# EasyEDA Pro project emg_analog_frontend.epro

# Schematic Schematic1
Assembly Variant: Basic; Board Name: Board1; Create Date: 2026-09-30; Page Name: P1; Project Name: esp32_demo; Schematic Name: Schematic1; Update Date: 2026-09-30; Company: 嘉立创EDA; Page Size: A4; Version: V1.0
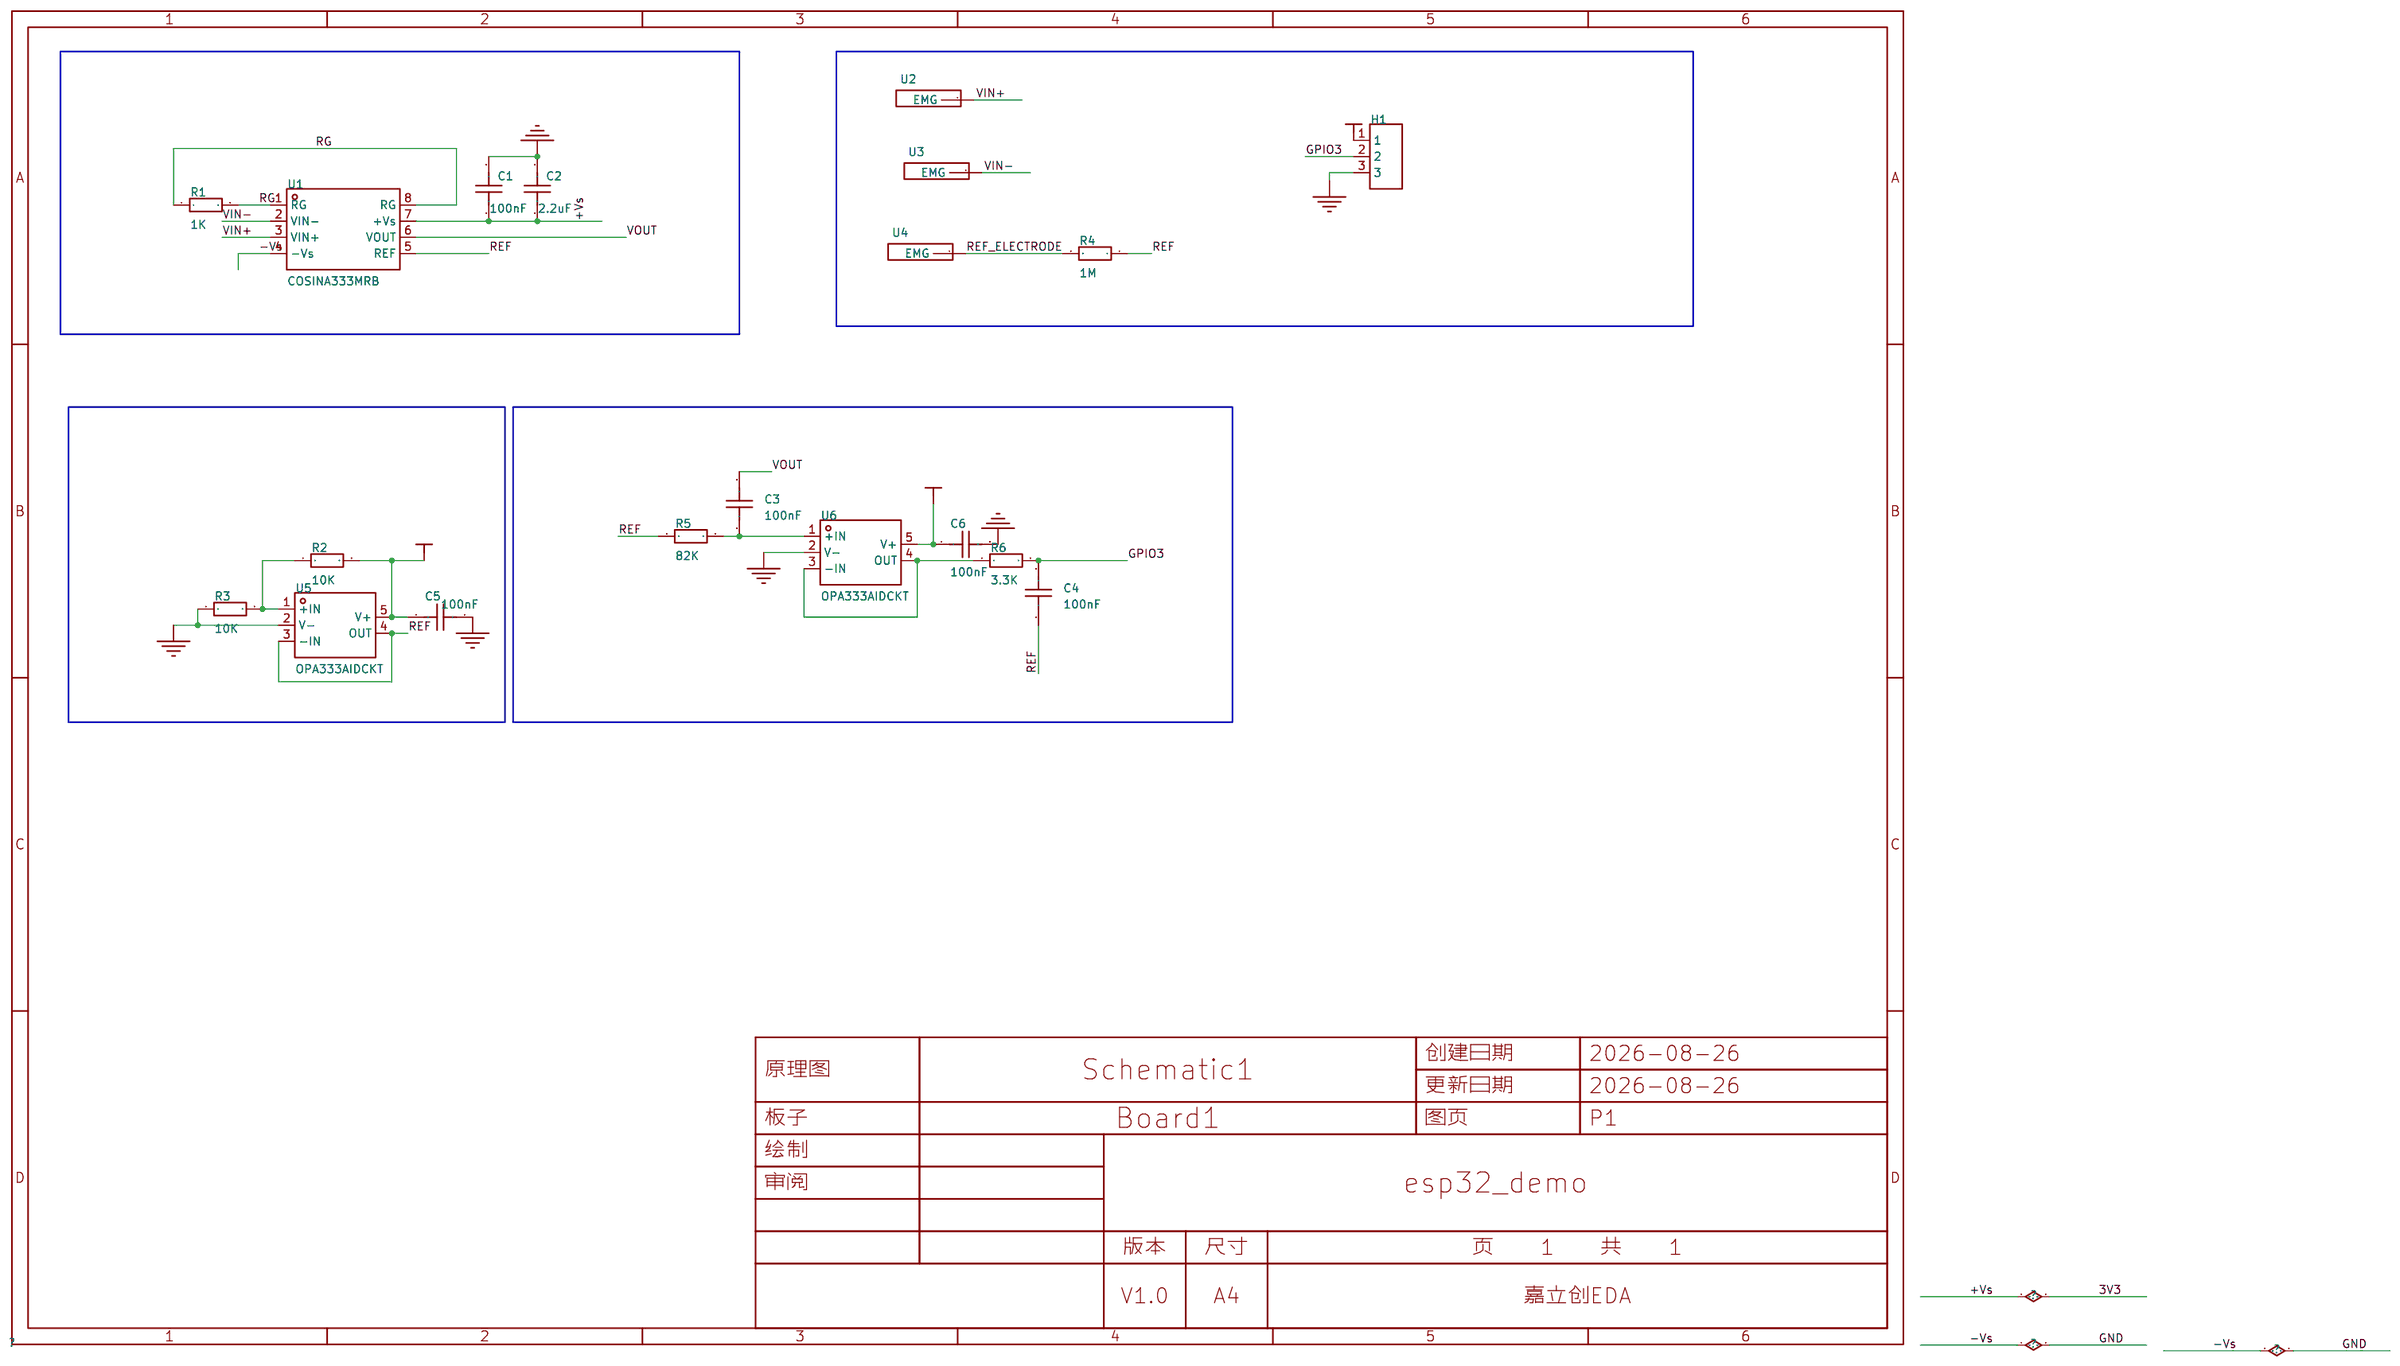
[diagram p0: schematic sheet]

## Parts
C1  100nF  [C0603]
C2  2.2uF  [C0603]
C3  100nF  [C0603]
C4  100nF  [C0603]
C5  100nF  [C0603]
C6  100nF  [C0603]
H1  -  [HDR-TH_3P-P2.54-V-F]
R1  1K  [R0603]
R2  10K  [R0603]
R3  10K  [R0603]
R4  1M  [R0603]
R5  82K  [R0603]
R6  3.3K  [R0603]
U1  COSINA333MRB  [MSOP-8_L3.0-W3.0-P0.65-LS4.9-BL]
U2  -  [sEMG_Electrode_12x6_R1.2]
U3  -  [sEMG_Electrode_12x6_R1.2]
U4  -  [sEMG_Electrode_12x6_R1.2]
U5  OPA333AIDCKT  [SC-70-5_L2.0-W1.3-P0.65-LS2.1-BL]
U6  OPA333AIDCKT  [SC-70-5_L2.0-W1.3-P0.65-LS2.1-BL]

## Library data of the parts
C1-C6 = CAP_0603: Supplier Footprint: 0603
H1 = HDR-F_2.54_1x3P: Supplier Part: C541850; Supplier Footprint: 插件
R1-R6 = Res_0603: Supplier Footprint: 0603
U1 = COSINA333MRB: 放大器数:单路;共模抑制比(CMRR):120dB;输入偏置电流(Ib):200pA;输入失调电压(Vos):25uV;压摆率(SR):0.25V/us;轨到轨:轨到轨输入,轨到轨输出;; LCSC Part Name: 1.8V - 5.5V, 70uA, RRIO零漂移仪表放大器; Supplier Part: C17702539; Manufacturer: COSINE(科山芯创); Supplier Footprint: MSOP-8; JLCPCB Part Class: Extended Part; Datasheet: https://item.szlcsc.com/datasheet/COSINA333MRB/18841710.html; Supplier: LCSC; Number of Channels: 单路; Common Mode Rejection Ratio(CMRR): 120dB; Ib - Input Bias Current: 200pA; Vos - Input Offset Voltage: 25uV; Slew Rate: 0.25V/us; Output Current: 50mA; Rail to Rail: 轨到轨输入,轨到轨输出; Quiescent Current(Iq): 70uA; Input Offset Voltage Drift(Vos TC): 50nV/℃; Operating Temperature: -40℃~+125℃; Input Voltage Noise Density: 50nV/√Hz@1kHz; Input Offset Current(Ios): 3pA; Single Supply: 1.8V~5.5V; Dual Supply: -2.75V~-900mV；900mV~2.75V; Power Supply Rejection Ratio (PSRR): 130dB; Features: 外部电阻增益；零漂移/自动稳零
U2-U4 = sEMG_Electrode_Oval_12x6: 腰圆形体表肌电干电极，12×6mm，底层焊盘
U5 U6 = OPA333AIDCKT: 放大器数:单路;增益带宽积(GBP):350kHz;输入偏置电流(Ib):70pA;输入失调电压(Vos):10uV;压摆率(SR):0.16V/us;轨到轨:轨到轨输入,轨到轨输出;; LCSC Part Name: OPAx333 1.8V微功耗CMOS运算放大器零漂移系列; Supplier Part: C2057324; Manufacturer: TI(德州仪器); Supplier Footprint: SC-70-5; JLCPCB Part Class: Extended Part; Datasheet: https://www.ti.com/cn/lit/gpn/opa333; Supplier: LCSC; Number of Channels: 单路; Gain Bandwidth Product: 350kHz; Ib - Input Bias Current: 70pA; Vos - Input Offset Voltage: 10uV; Common Mode Rejection Ratio(CMRR): 130dB; Slew Rate: 0.16V/us; Output Current: 5mA; Rail to Rail: 轨到轨输入,轨到轨输出; Input Offset Voltage Drift(Vos TC): 50nV/℃; Quiescent Current(Iq): 17uA; Operating Temperature: -40℃~+125℃; Single Supply: 1.8V~5.5V; Maximum Power Supply Range (Vdd-Vss): 5.5V; Input Offset Current(Ios): 400pA

## Nets
3V3: C1.1 C2.1 C5.1 C6.1 H1.1 R2.2 U1.7(+Vs) U5.5(V+) U6.5(V+)
GND: C1.2 C2.2 C5.2 C6.2 H1.3 R3.1 U1.4(-Vs) U5.2(V-) U6.2(V-)
VIN+: U1.3(VIN+) U2.1(EMG)
VIN-: U1.2(VIN-) U3.1(EMG)
GPIO3: C4.2 H1.2 R6.2
REF: C4.1 R4.1 R5.1 U1.5(REF) U5.3(-IN) U5.4(OUT)
REF_ELECTRODE: R4.2 U4.1(EMG)
RG: R1.1 R1.2 U1.1(RG) U1.8(RG)
VOUT: C3.2 U1.6(VOUT)
$1N87: R2.1 R3.2 U5.1(+IN)
$1N101: C3.1 R5.2 U6.1(+IN)
$1N103: R6.1 U6.3(-IN) U6.4(OUT)

# Board PCB1
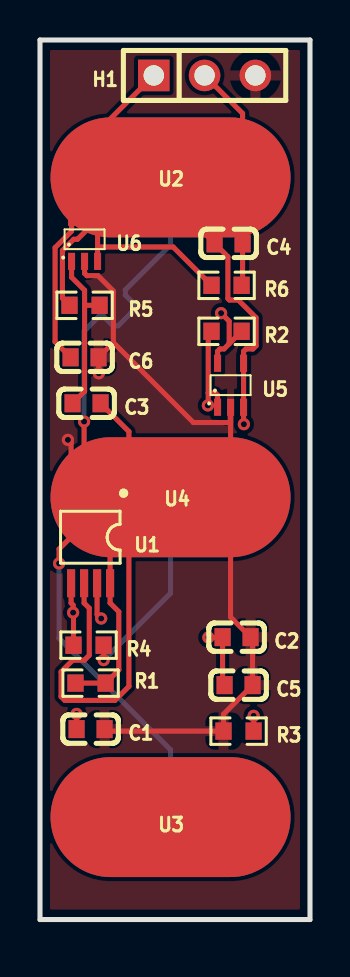
[diagram p1: board, top side]
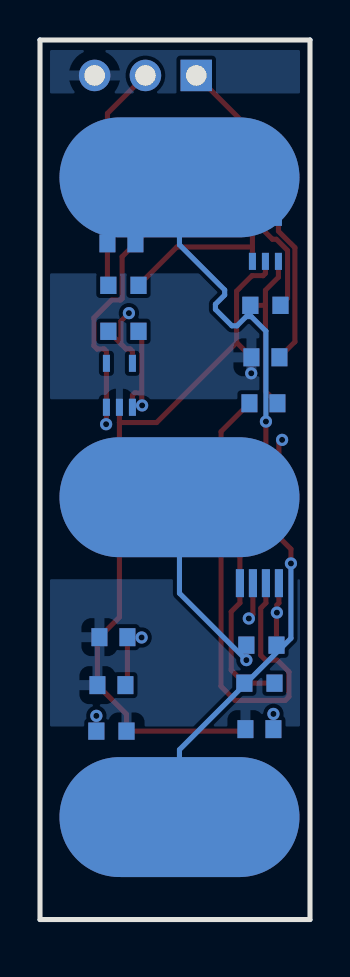
[diagram p2: board, bottom side, seen from below]

Outline 13.5 x 44 mm; copper layers: Top Layer, Inner1, Inner2, Bottom Layer. Coordinates in mm from the lower left corner of the outline.
Outline path: 0,44 13.5,44 13.5,0 0,0 0,44
Stack: Top Layer 0.035mm Outer layer thickness 1oz / Dielectric1 0.2104mm 7628 RC49% 8.6mil er 4.4 / Inner1 0.0152mm Inner layer thickness / Dielectric2 1.065mm 1.1mm H/HOZ Copper er 4.43 / Inner2 0.0152mm Inner layer thickness / Dielectric3 0.2104mm 7628 RC49% 8.6mil er 4.4 / Bottom Layer 0.035mm Outer layer thickness 1oz

## Design rules (mm)
spacing copperThickness1oz (default): track to track 0.102, other pairs 0.152 to 0.3
spacing copperThickness2oz: track to track 0.203, other pairs 0.152 to 0.3
spacing Plane_innerPlane: track to track 0.102, other pairs 0.152 to 0.3
spacing Copper_copperRegion: track to track 0.102, other pairs 0.152 to 0.3
track width copperThickness1oz (default): min 0.127, default 0.254, max 2.54
track width copperThickness2oz: min 0.203, default 0.254, max 2.54
differential pair differentialPair (default): width min 0.127, default 0.254, max 2.54; gap min 0.152, default 0.152
net GND uses copperRegion

## Placement (name value [footprint] x y rotation side)
C1  100nF  [C0603]  2.53 9.53 0 top
C2  2.2uF  [C0603]  9.83 14.13 0 top
C3  100nF  [C0603]  2.33 25.83 0 top
C4  100nF  [C0603]  9.43 33.83 0 top
C5  100nF  [C0603]  9.93 11.73 0 top
C6  100nF  [C0603]  2.23 28.13 0 top
H1  -  [HDR-TH_3P-P2.54-V-F]  8.23 42.23 0 top
R1  1K  [R0603]  2.53 11.83 0 top
R2  10K  [R0603]  9.33 29.43 0 top
R3  10K  [R0603]  9.93 9.43 0 top
R4  1M  [R0603]  2.43 13.73 0 top
R5  82K  [R0603]  2.23 30.73 0 top
R6  3.3K  [R0603]  9.33 31.73 0 top
U1  COSINA333MRB  [MSOP-8_L3.0-W3.0-P0.65-LS4.9-BL]  2.53 19.13 180 top
U2  -  [sEMG_Electrode_12x6_R1.2]  6.53 37.13 0 top
U3  -  [sEMG_Electrode_12x6_R1.2]  6.53 5.13 0 top
U4  -  [sEMG_Electrode_12x6_R1.2]  6.53 21.13 0 top
U5  OPA333AIDCKT  [SC-70-5_L2.0-W1.3-P0.65-LS2.1-BL]  9.53 26.73 0 top
U6  OPA333AIDCKT  [SC-70-5_L2.0-W1.3-P0.65-LS2.1-BL]  2.23 34.03 0 top

## Footprints (pads in the part's own frame, mm; a bottom-side part is the same pattern mirrored in y, then rotated)
C0603
  rect 0.8x0.9 hole 0.001: 1(-0.7,0) 2(0.7,0)
HDR-TH_3P-P2.54-V-F
  rect 1.575x1.575 hole 1.02: 1(-2.54,0)
  round 1.575 hole 1.02: 2(0,0) 3(2.54,0)
MSOP-8_L3.0-W3.0-P0.65-LS4.9-BL
  rect 0.406x1.397 hole 0.001: 1(-0.975,-2.3) 2(-0.325,-2.3) 3(0.325,-2.3) 4(0.975,-2.3) 5(0.975,2.3) 6(0.325,2.3) 7(-0.325,2.3) 8(-0.975,2.3)
R0603
  rect 0.806x0.864 hole 0.001: 1(-0.753,0) 2(0.753,0)
SC-70-5_L2.0-W1.3-P0.65-LS2.1-BL
  rect 0.35x0.85 hole 0.001: 1(-0.65,-1.1) 2(0,-1.1) 3(0.65,-1.1) 4(0.65,1.1) 5(-0.65,1.1)
sEMG_Electrode_12x6_R1.2
  oval 12x6 hole 0.001: 1(0,0)

## Nets
As in the schematic.

## Via types
v1: diameter 0.61, hole 0.305, Top Layer to Bottom Layer, 13 vias

## Routing (per net, layer and track width the routed paths; a pad name or vN(x,y) marks a point on that pad's centre or on a via; arc(x,y) is an arc through that point)
3V3: length 68.5
  Top Layer w0.254: H1.1 1.58,38.12 U6.5 1.58,34.44 0.75,33.61 0.75,28.9 C6.1 ; 9.46,28.8 9.2,28.54 9,28.54 8.88,28.43 U5.5 ; 9.46,28.8 9.46,29.93 v1(9.06,30.33) ; 9.46,28.8 R2.2 ; 9.13,14.11 9.13,11.83 C5.1 ; 9.13,14.11 v1(8.42,14.11) ; 9.13,14.11 C2.1 ; v1(3.06,15.06) 2.85,15.27 U1.7 ; C1.1 v1(1.83,10.29)
  Inner1 w0.254: v1(8.42,14.11) 4.01,14.11 v1(3.06,15.06) 1.83,13.83 v1(1.83,10.29)
  Inner2 w0.254: H1.1 5.69,32.01 7.37,30.33 ; 7.37,30.33 v1(9.06,30.33) ; 7.37,30.33 7.37,19.37 v1(3.06,15.06)
GND: length 64.8
  Top Layer w0.254: v1(2.94,27.33) 2.94,28.12 C6.2 3.67,28.87 ; 9.53,24.86 9.53,15.13 C2.2 10.63,14.03 C5.2 9.18,10.27 9.18,9.43 3.33,9.43 C1.2 ; 9.53,24.86 U5.2 ; 9.53,24.86 7.67,24.86 3.67,28.87 ; U1.4 1.55,23.84 v1(1.4,24) ; 3.67,28.87 3.67,31.44 2.9,32.21 2.35,32.21 2.23,32.33 U6.2
  Inner1 w0.254: H1.3 10.77,30.88 7.21,27.33 v1(2.94,27.33) 1.4,25.78 v1(1.4,24)
VIN+: length 19.1
  Top Layer w0.254: U1.3 v1(2.2,24.91)
  Bottom Layer w0.254: v1(2.2,24.91) 2.2,29.43 2.94,30.16 3.19,30.16 3.65,29.7 3.91,29.7 4.73,30.53 4.73,30.78 4.27,31.24 4.27,31.5 6.53,33.76 U2.1
VIN-: length 19.4
  Top Layer w0.254: v1(0.95,17.81) 0.95,18.53 2.85,20.44 U1.2
  Bottom Layer w0.254: v1(0.95,17.81) 0.95,14.07 6.53,8.5 U3.1
GPIO3: length 11.3
  Top Layer w0.254: H1.2 10.13,40.33 C4.2 10.13,31.77 R6.2
REF: length 39.7
  Top Layer w0.254: 1.48,30.73 1.12,31.08 1.12,33.47 1.68,34.03 1.88,34.03 2.41,34.56 2.41,35.66 2.59,35.83 6.72,35.83 C4.1 9.4,33.16 9.4,31.07 9.47,30.99 9.91,30.99 10.8,30.1 10.8,28.7 10.65,28.54 10.3,28.54 10.18,28.43 U5.4 U5.3 10.18,24.91 10.19,24.89 v1(10.19,24.78) ; U1.5 1.55,15.84 1.66,15.73 v1(1.66,15.35) 1.68,15.33 R4.1
  Inner1 w0.254: v1(1.66,15.35) 1.66,16.24 v1(10.19,24.78)
REF_ELECTRODE: length 10.3
  Top Layer w0.254: R4.2 v1(3.18,12.98)
  Bottom Layer w0.254: v1(3.18,12.98) 6.53,16.32 U4.1
RG: length 11.6
  Top Layer w0.254: 1.78,11.83 R1.2 3.94,12.48 3.94,15.4 3.5,15.84 U1.8 U1.1
VOUT: length 25.2
  Top Layer w0.254: U1.6 2.2,15.84 2.46,15.58 2.46,13.22 2.22,12.98 1.64,12.98 1.05,12.39 1.05,11.15 1.24,10.96 3.75,10.96 4.45,11.66 4.45,24.41 C3.2
$1N87: length 23.2
  Top Layer w0.254: R3.2 v1(10.68,10.19) ; v1(8.39,25.72) 8.41,25.74 8.41,26.34 ; 8.41,26.34 8.76,26.34 8.88,26.23 U5.1 ; 8.41,26.34 8.41,29.26 R2.1
  Inner1 w0.254: v1(8.39,25.72) 10.09,25.72 10.82,24.99 10.82,10.33 v1(10.68,10.19)
$1N101: length 8.4
  Top Layer w0.254: C3.1 2.23,26.43 2.23,30.73 ; 2.23,30.73 2.23,31.48 1.58,32.13 U6.1 ; 2.23,30.73 R5.2
$1N103: length 8.7
  Top Layer w0.254: U6.3 2.88,33.64 ; 2.88,33.64 U6.4 ; 2.88,33.64 6.66,33.64 R6.1

## Copper pours and planes (outline as drawn; the poured copper is in the pictures)
GND on Top Layer: -0.77,46.53 14.83,46.53 14.83,-1.17 -0.77,-1.17
GND on Bottom Layer: -0.77,44.73 15.73,44.73 15.73,-0.57 -0.77,-0.57
